# Altium schematic sheet Top-Sheet.SchDoc
size A4; SheetNumber: 1; SheetTotal: 3
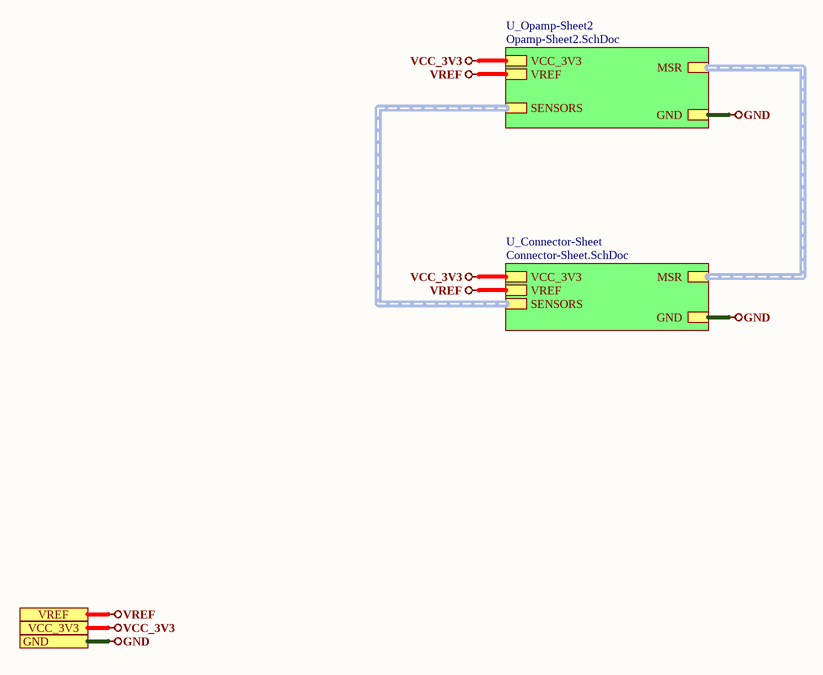
[diagram p0: Top-Sheet.SchDoc]

## Sub-sheets
U_Connector-Sheet = Connector-Sheet.SchDoc: SENSORS (harness SENSORS), VCC_3V3, GND, MSR (harness MSR), VREF
U_Opamp-Sheet2 = Opamp-Sheet2.SchDoc: VCC_3V3, GND, VREF, SENSORS (harness SENSORS), MSR (harness MSR)

## Ports
GND, VCC_3V3, VREF

## Nets
GND: port GND, sheet U_Opamp-Sheet2/GND, sheet U_Connector-Sheet/GND
VCC_3V3: port VCC_3V3, sheet U_Opamp-Sheet2/VCC_3V3, sheet U_Connector-Sheet/VCC_3V3
VREF: port VREF, sheet U_Opamp-Sheet2/VREF, sheet U_Connector-Sheet/VREF

## Buses and harness runs
harness sheet U_Connector-Sheet/MSR = sheet U_Opamp-Sheet2/MSR
harness sheet U_Connector-Sheet/SENSORS = sheet U_Opamp-Sheet2/SENSORS

## Notes on the sheet
- 1
- Huzaifa Ali